# Altium project PCB_Practice.PrjPcb
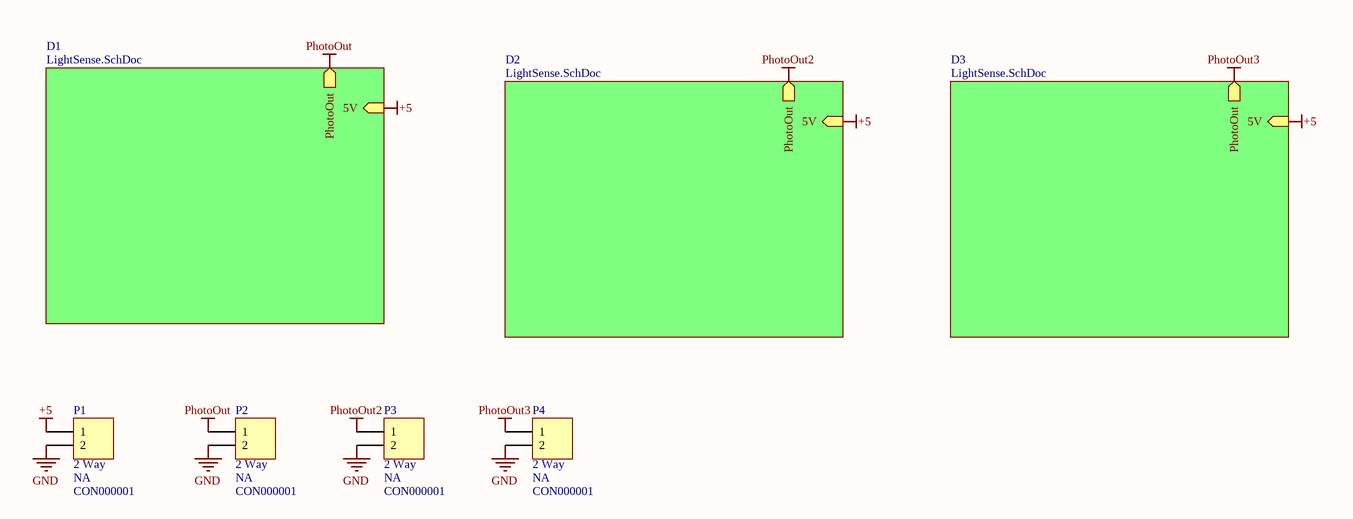
[diagram p0: 311prac.SchDoc]
2 sheets, 34 parts. Net scope: hierarchical (ports join the sheet entries above them; power ports are global).
Board file: PCB2.PcbDoc
Sheets:
  311prac.SchDoc
    D1 = LightSense.SchDoc
    D2 = LightSense.SchDoc
    D3 = LightSense.SchDoc

## Sheet 311prac.SchDoc
size A4; SheetNumber: 1; SheetTotal: 2

### Parts
P1  CON000001  value 2 Way  Component Type: NA  [ECE-600102STTH]
P2  CON000001  value 2 Way  Component Type: NA  [ECE-600102STTH]
P3  CON000001  value 2 Way  Component Type: NA  [ECE-600102STTH]
P4  CON000001  value 2 Way  Component Type: NA  [ECE-600102STTH]

### Sub-sheets
D1 = LightSense.SchDoc: PhotoOut (out), 5V (in)
D2 = LightSense.SchDoc: PhotoOut (out), 5V (in)
D3 = LightSense.SchDoc: PhotoOut (out), 5V (in)

### Nets
+5: P1.1 ; sheet D1/5V, sheet D2/5V, sheet D3/5V
GND: P1.2 P2.2 P3.2 P4.2
PhotoOut: P2.1 ; sheet D1/PhotoOut
PhotoOut2: P3.1 ; sheet D2/PhotoOut
PhotoOut3: P4.1 ; sheet D3/PhotoOut

### Library data of the parts
P1-P4 = CMP-040-000000-1: HEADER POLARISED 2WAY TH; Manufacturer-PN: 600102ST; Manufactuer: GTK; Path: ece/ts/Lists/Stock Inventory; Assembly Method: Through hole; Item Type: Item; Supplier2: Active Components; Status: Active; Category: Connector; Supplier2-PN: 600102ST; Supplier1: Elecon; Size/Package: 2.54 Radial; UoA Stock#: CON000001; Datasheet Link: http://share.engineering.auckland.ac.nz/ece/ts/Student%20Documents/polarised_connectors.pdf; Supplier1-PN: YY3N02

## Sheet LightSense.SchDoc
size A4; SheetNumber: 2; SheetTotal: 2
Used 3 times, as channels D1, D2, D3. Parts and nets are listed once, with the designators drawn on the sheet.
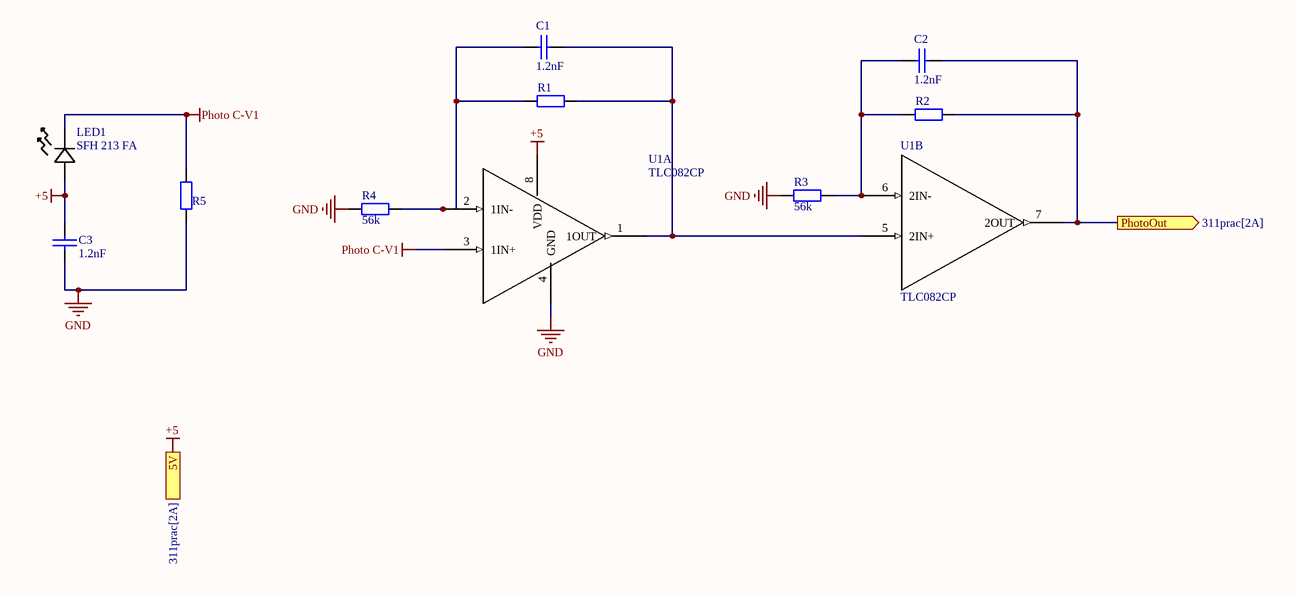
[diagram p1: LightSense.SchDoc]

### Parts
C1  value 1.2nF  [ECE-CAPR0.2x0.1TH]  (hidden comment: CAP000026)
C2  value 1.2nF  [ECE-CAPR0.2x0.1TH]  (hidden comment: CAP000026)
C3  value 1.2nF  [ECE-CAPR0.2x0.1TH]  (hidden comment: CAP000026)
LED1  SFH 213 FA  [LED_SFH 213 FA_OSR]
R1  RES000058  [ECE-RESA0.4TH]  (value not drawn)
R2  RES000058  [ECE-RESA0.4TH]  (value not drawn)
R3  value 56k  [ECE-RESA0.4TH]
R4  value 56k  [ECE-RESA0.4TH]  (hidden comment: RES000058)
R5  RES000058  [ECE-RESA0.4TH]  (value not drawn)
U1  TLC082CP  [TLC082_TH]  (parts A,B of 2)

### Ports
5V (in, see 311prac[2A]), PhotoOut (out, see 311prac[2A])

### Nets
+5: C3.2 LED1.2 U1.8(VDD) ; port 5V
GND: C3.1 R3.1 R4.1 R5.1 U1.4(GND)
Photo C-V1: LED1.1 R5.2 U1.3(1IN+)
PhotoOut: C2.2 R2.2 U1.7(2OUT) ; port PhotoOut
NetC1_1: C1.1 R1.1 R4.2 U1.2(1IN-)
NetC1_2: C1.2 R1.2 U1.1(1OUT) U1.5(2IN+)
NetC2_1: C2.1 R2.1 R3.2 U1.6(2IN-)

### Channels
D1: designators end in _D1; ports 5V=+5 PhotoOut=PhotoOut
D2: designators end in _D2; ports 5V=+5 PhotoOut=PhotoOut2
D3: designators end in _D3; ports 5V=+5 PhotoOut=PhotoOut3

### Library data of the parts
C1-C3 = CMP-039-000025-1: CAP CER 1.2nF 50V TH; Path: ece/ts/Lists/Stock Inventory; Assembly Method: Through hole; Item Type: Item; Status: Obsolete; Component Type: NA; UoA Stock#: CAP000026; Datasheet Link: http://share.engineering.auckland.ac.nz/ece/ts/Student%20Documents/CER%20CAP.pdf; Size/Package: Radial; Voltage/Current: 50V; Category: Capacitor
LED1 = SFH 213 FA: Description; Manufacturer_Name: ams OSRAM; Copyright: Copyright (C) 2026 Ultra Librarian. All rights reserved.; Manufacturer_Part_Number: SFH 213 FA
R1 R2 R4 R5 = CMP-052-000057-1: RES MF 56K TH; Path: ece/ts/Lists/Stock Inventory; Voltage/Current: 0.6W; Item Type: Item; Assembly Method: Through hole; Component Type: NA; Size/Package: Axial 10mm; Supplier1: Active components; UoA Stock#: RES000058; Supplier1-PN: T442124; Category: Resistor; Status: Active
  R1 R2 R5: Value: 56k
R3 = CMP-052-000057-1: RES MF 56K TH; Path: ece/ts/Lists/Stock Inventory; Voltage/Current: 0.6W; Item Type: Item; Assembly Method: Through hole; UoA Stock#: RES000058; Component Type: NA; Size/Package: Axial 10mm; Supplier1: Active components; Supplier1-PN: T442124; Category: Resistor; Status: Active
U1 = TLC082CP: Dual, 16-V, 10-MHz, In to V- op amp 8-PDIP 0 to 70; Manufacturer_Name: Texas Instruments; Copyright: Copyright (C) 2026 Ultra Librarian. All rights reserved.; Manufacturer_Part_Number: TLC082CP; Datasheet: https://www.ti.com/lit/gpn/tlc082; RefDes: RefDes; Type: Type

## Nets that join several sheets
+5: 311prac (P1.1), D1 (C3_D1.2 LED1_D1.2 U1_D1.8), D2 (C3_D2.2 LED1_D2.2 U1_D2.8), D3 (C3_D3.2 LED1_D3.2 U1_D3.8)
GND: 311prac (P1.2 P2.2 P3.2 P4.2), D1 (5 pins), D2 (5 pins), D3 (5 pins)
Photo C-V1: D1 (LED1_D1.1 R5_D1.2 U1_D1.3), D2 (LED1_D2.1 R5_D2.2 U1_D2.3), D3 (LED1_D3.1 R5_D3.2 U1_D3.3)
PhotoOut: 311prac (P2.1), D1 (C2_D1.2 R2_D1.2 U1_D1.7)
PhotoOut2: 311prac (P3.1), D2 (C2_D2.2 R2_D2.2 U1_D2.7)
PhotoOut3: 311prac (P4.1), D3 (C2_D3.2 R2_D3.2 U1_D3.7)